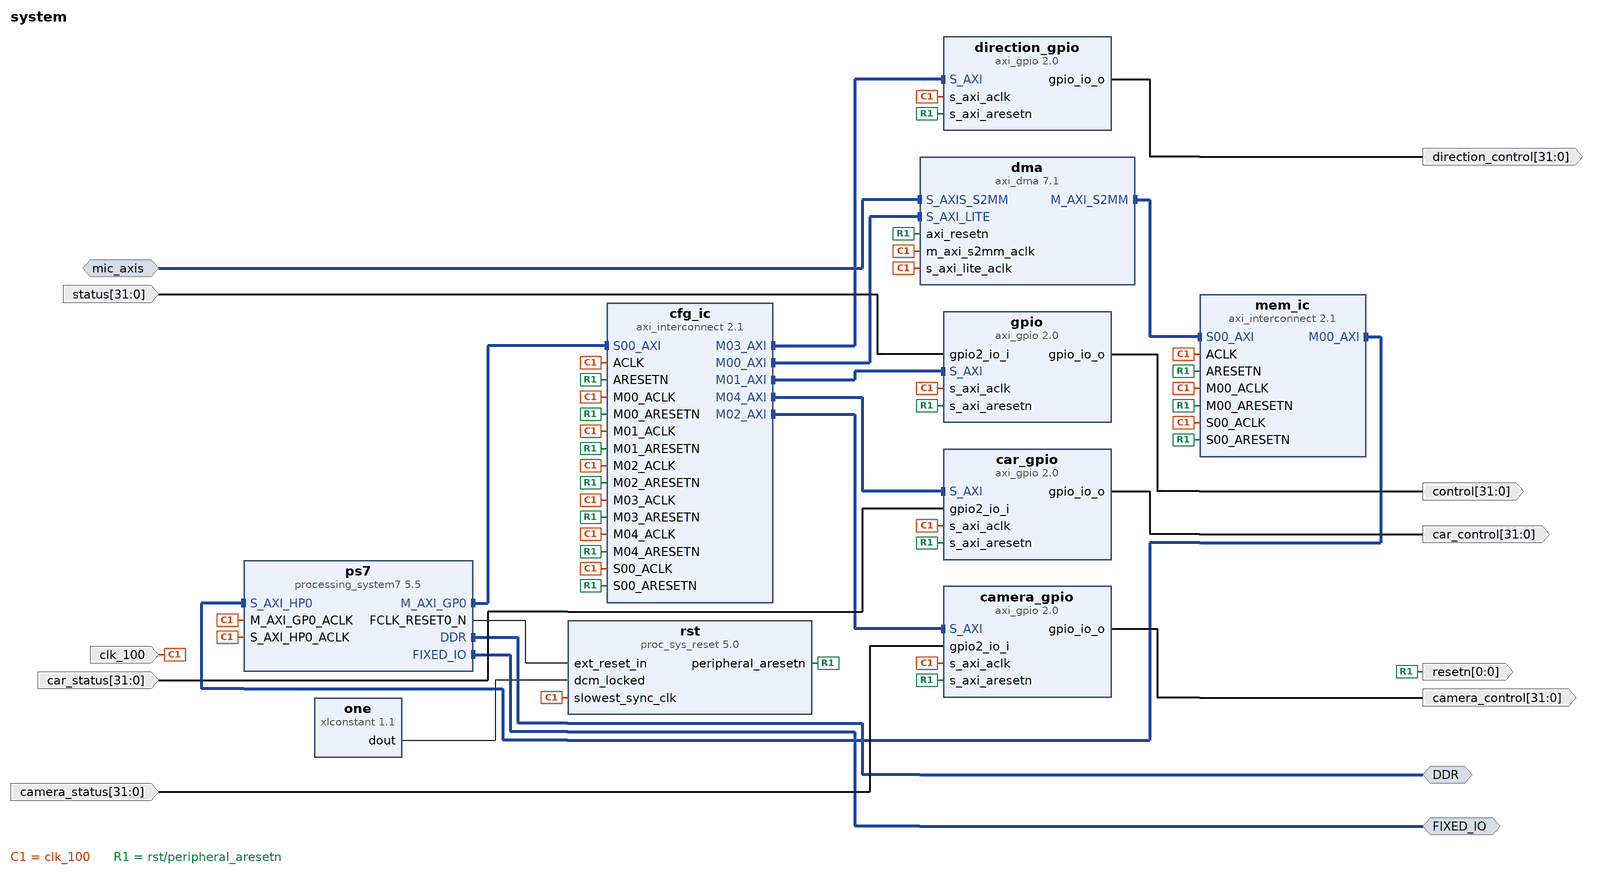
[diagram p0: block diagram of the top level]
# Vivado block design system, xc7z100ffg900-2, Vivado 2025.2
create_bd_design system

create_bd_intf_port -mode Master -vlnv xilinx.com:interface:ddrx_rtl:1.0 DDR
create_bd_intf_port -mode Master -vlnv xilinx.com:display_processing_system7:fixedio_rtl:1.0 FIXED_IO
create_bd_intf_port -mode Slave -vlnv xilinx.com:interface:axis_rtl:1.0 mic_axis
set_property -dict [list \
  CONFIG.FREQ_HZ 100000000 \
  CONFIG.HAS_TKEEP 1 \
  CONFIG.HAS_TLAST 1 \
  CONFIG.HAS_TREADY 1 \
  CONFIG.HAS_TSTRB 0 \
  CONFIG.LAYERED_METADATA undef \
  CONFIG.TDATA_NUM_BYTES 4 \
  CONFIG.TDEST_WIDTH 0 \
  CONFIG.TID_WIDTH 0 \
  CONFIG.TUSER_WIDTH 0 \
] [get_bd_intf_ports mic_axis]
create_bd_port -dir I -type clk clk_100
set_property -dict {CONFIG.ASSOCIATED_BUSIF mic_axis CONFIG.FREQ_HZ 100000000} [get_bd_ports clk_100]
create_bd_port -dir O -from 0 -to 0 -type rst resetn
set_property -dict {CONFIG.POLARITY ACTIVE_LOW} [get_bd_ports resetn]
create_bd_port -dir O -from 31 -to 0 control
create_bd_port -dir I -from 31 -to 0 status
create_bd_port -dir O -from 31 -to 0 camera_control
create_bd_port -dir I -from 31 -to 0 camera_status
create_bd_port -dir O -from 31 -to 0 direction_control
create_bd_port -dir O -from 31 -to 0 car_control
create_bd_port -dir I -from 31 -to 0 car_status

create_bd_cell -type ip -vlnv xilinx.com:ip:processing_system7:5.5 ps7
set_property -dict [list \
  CONFIG.PCW_APU_PERIPHERAL_FREQMHZ 666.666666 \
  CONFIG.PCW_CPU_CPU_6X4X_MAX_RANGE 800 \
  CONFIG.PCW_ENET0_PERIPHERAL_ENABLE 0 \
  CONFIG.PCW_FPGA0_PERIPHERAL_FREQMHZ 100 \
  CONFIG.PCW_FPGA1_PERIPHERAL_FREQMHZ 25 \
  CONFIG.PCW_GPIO_MIO_GPIO_ENABLE 0 \
  CONFIG.PCW_PERIPHERAL_BOARD_PRESET None \
  CONFIG.PCW_PRESET_BANK1_VOLTAGE {LVCMOS 1.8V} \
  CONFIG.PCW_QSPI_PERIPHERAL_ENABLE 0 \
  CONFIG.PCW_SD0_PERIPHERAL_ENABLE 0 \
  CONFIG.PCW_UART0_PERIPHERAL_ENABLE 1 \
  CONFIG.PCW_UART0_UART0_IO {MIO 14 .. 15} \
  CONFIG.PCW_UART1_PERIPHERAL_ENABLE 0 \
  CONFIG.PCW_UART_PERIPHERAL_FREQMHZ 100 \
  CONFIG.PCW_UIPARAM_DDR_FREQ_MHZ 533.3333333333333 \
  CONFIG.PCW_UIPARAM_DDR_MEMORY_TYPE {DDR 3 (Low Voltage)} \
  CONFIG.PCW_UIPARAM_DDR_PARTNO {MT41K256M16 RE-125} \
  CONFIG.PCW_USB0_PERIPHERAL_ENABLE 0 \
  CONFIG.PCW_USB1_PERIPHERAL_ENABLE 1 \
  CONFIG.PCW_USB1_USB1_IO {MIO 40 .. 51} \
  CONFIG.PCW_USE_S_AXI_HP0 1 \
] [get_bd_cells ps7]
# 368 more settings of ps7 are not shown: defaults, MIO pin electricals, DDR timing, and values the tool derives
create_bd_cell -type ip -vlnv xilinx.com:ip:proc_sys_reset:5.0 rst
create_bd_cell -type ip -vlnv xilinx.com:ip:xlconstant:1.1 one
set_property -dict {CONFIG.CONST_VAL 1} [get_bd_cells one]
create_bd_cell -type ip -vlnv xilinx.com:ip:axi_dma:7.1 dma
set_property -dict [list \
  CONFIG.c_include_mm2s 0 \
  CONFIG.c_include_s2mm_dre 0 \
  CONFIG.c_include_sg 0 \
  CONFIG.c_s_axis_s2mm_tdata_width 32 \
  CONFIG.c_sg_length_width 23 \
] [get_bd_cells dma]
create_bd_cell -type ip -vlnv xilinx.com:ip:axi_gpio:2.0 gpio
set_property -dict [list \
  CONFIG.C_ALL_INPUTS_2 1 \
  CONFIG.C_ALL_OUTPUTS 1 \
  CONFIG.C_GPIO2_WIDTH 32 \
  CONFIG.C_GPIO_WIDTH 32 \
  CONFIG.C_IS_DUAL 1 \
] [get_bd_cells gpio]
create_bd_cell -type ip -vlnv xilinx.com:ip:axi_interconnect:2.1 cfg_ic
set_property -dict {CONFIG.NUM_MI 5} [get_bd_cells cfg_ic]
create_bd_cell -type ip -vlnv xilinx.com:ip:axi_interconnect:2.1 mem_ic
set_property -dict {CONFIG.NUM_MI 1} [get_bd_cells mem_ic]
create_bd_cell -type ip -vlnv xilinx.com:ip:axi_gpio:2.0 camera_gpio
set_property -dict [list \
  CONFIG.C_ALL_INPUTS_2 1 \
  CONFIG.C_ALL_OUTPUTS 1 \
  CONFIG.C_GPIO2_WIDTH 32 \
  CONFIG.C_GPIO_WIDTH 32 \
  CONFIG.C_IS_DUAL 1 \
] [get_bd_cells camera_gpio]
create_bd_cell -type ip -vlnv xilinx.com:ip:axi_gpio:2.0 direction_gpio
set_property -dict {CONFIG.C_ALL_OUTPUTS 1 CONFIG.C_GPIO_WIDTH 32 CONFIG.C_IS_DUAL 0} [get_bd_cells direction_gpio]
create_bd_cell -type ip -vlnv xilinx.com:ip:axi_gpio:2.0 car_gpio
set_property -dict [list \
  CONFIG.C_ALL_INPUTS_2 1 \
  CONFIG.C_ALL_OUTPUTS 1 \
  CONFIG.C_GPIO2_WIDTH 32 \
  CONFIG.C_GPIO_WIDTH 32 \
  CONFIG.C_IS_DUAL 1 \
] [get_bd_cells car_gpio]

# ---- connections ----

connect_bd_intf_net [get_bd_intf_pins cfg_ic/M00_AXI] [get_bd_intf_pins dma/S_AXI_LITE]
connect_bd_intf_net [get_bd_intf_pins cfg_ic/M01_AXI] [get_bd_intf_pins gpio/S_AXI]
connect_bd_intf_net [get_bd_intf_pins cfg_ic/M02_AXI] [get_bd_intf_pins camera_gpio/S_AXI]
connect_bd_intf_net [get_bd_intf_pins cfg_ic/M03_AXI] [get_bd_intf_pins direction_gpio/S_AXI]
connect_bd_intf_net [get_bd_intf_pins cfg_ic/M04_AXI] [get_bd_intf_pins car_gpio/S_AXI]
connect_bd_intf_net [get_bd_intf_pins dma/M_AXI_S2MM] [get_bd_intf_pins mem_ic/S00_AXI]
connect_bd_intf_net [get_bd_intf_pins mem_ic/M00_AXI] [get_bd_intf_pins ps7/S_AXI_HP0]
connect_bd_intf_net [get_bd_intf_ports mic_axis] [get_bd_intf_pins dma/S_AXIS_S2MM]
connect_bd_intf_net [get_bd_intf_ports DDR] [get_bd_intf_pins ps7/DDR]
connect_bd_intf_net [get_bd_intf_ports FIXED_IO] [get_bd_intf_pins ps7/FIXED_IO]
connect_bd_intf_net [get_bd_intf_pins ps7/M_AXI_GP0] [get_bd_intf_pins cfg_ic/S00_AXI]
connect_bd_net [get_bd_pins camera_gpio/gpio_io_o] [get_bd_ports camera_control]
connect_bd_net [get_bd_ports camera_status] [get_bd_pins camera_gpio/gpio2_io_i]
connect_bd_net [get_bd_pins car_gpio/gpio_io_o] [get_bd_ports car_control]
connect_bd_net [get_bd_ports car_status] [get_bd_pins car_gpio/gpio2_io_i]
connect_bd_net -net clk_100_1 [get_bd_ports clk_100] \
  [get_bd_pins ps7/M_AXI_GP0_ACLK] [get_bd_pins ps7/S_AXI_HP0_ACLK] [get_bd_pins rst/slowest_sync_clk] \
  [get_bd_pins dma/s_axi_lite_aclk] [get_bd_pins dma/m_axi_s2mm_aclk] [get_bd_pins gpio/s_axi_aclk] [get_bd_pins cfg_ic/ACLK] \
  [get_bd_pins cfg_ic/S00_ACLK] [get_bd_pins cfg_ic/M00_ACLK] [get_bd_pins cfg_ic/M01_ACLK] [get_bd_pins mem_ic/ACLK] \
  [get_bd_pins mem_ic/S00_ACLK] [get_bd_pins mem_ic/M00_ACLK] [get_bd_pins camera_gpio/s_axi_aclk] \
  [get_bd_pins cfg_ic/M02_ACLK] [get_bd_pins direction_gpio/s_axi_aclk] [get_bd_pins cfg_ic/M03_ACLK] \
  [get_bd_pins car_gpio/s_axi_aclk] [get_bd_pins cfg_ic/M04_ACLK]
connect_bd_net [get_bd_pins direction_gpio/gpio_io_o] [get_bd_ports direction_control]
connect_bd_net [get_bd_pins gpio/gpio_io_o] [get_bd_ports control]
connect_bd_net [get_bd_pins one/dout] [get_bd_pins rst/dcm_locked]
connect_bd_net [get_bd_pins ps7/FCLK_RESET0_N] [get_bd_pins rst/ext_reset_in]
connect_bd_net [get_bd_pins rst/peripheral_aresetn] \
  [get_bd_ports resetn] [get_bd_pins dma/axi_resetn] [get_bd_pins gpio/s_axi_aresetn] [get_bd_pins cfg_ic/ARESETN] \
  [get_bd_pins cfg_ic/S00_ARESETN] [get_bd_pins cfg_ic/M00_ARESETN] [get_bd_pins cfg_ic/M01_ARESETN] \
  [get_bd_pins mem_ic/ARESETN] [get_bd_pins mem_ic/S00_ARESETN] [get_bd_pins mem_ic/M00_ARESETN] \
  [get_bd_pins camera_gpio/s_axi_aresetn] [get_bd_pins cfg_ic/M02_ARESETN] [get_bd_pins direction_gpio/s_axi_aresetn] \
  [get_bd_pins cfg_ic/M03_ARESETN] [get_bd_pins car_gpio/s_axi_aresetn] [get_bd_pins cfg_ic/M04_ARESETN]
connect_bd_net [get_bd_ports status] [get_bd_pins gpio/gpio2_io_i]

# ---- address map ----
assign_bd_address -offset 0x00000000 -range 1G -target_address_space [get_bd_addr_spaces dma/Data_S2MM] [get_bd_addr_segs ps7/S_AXI_HP0/HP0_DDR_LOWOCM]
assign_bd_address -offset 0x40400000 -range 64K -target_address_space [get_bd_addr_spaces ps7/Data] [get_bd_addr_segs dma/S_AXI_LITE/Reg]
assign_bd_address -offset 0x41200000 -range 64K -target_address_space [get_bd_addr_spaces ps7/Data] [get_bd_addr_segs gpio/S_AXI/Reg]
assign_bd_address -offset 0x41210000 -range 64K -target_address_space [get_bd_addr_spaces ps7/Data] [get_bd_addr_segs camera_gpio/S_AXI/Reg]
assign_bd_address -offset 0x41220000 -range 64K -target_address_space [get_bd_addr_spaces ps7/Data] [get_bd_addr_segs direction_gpio/S_AXI/Reg]
assign_bd_address -offset 0x41230000 -range 64K -target_address_space [get_bd_addr_spaces ps7/Data] [get_bd_addr_segs car_gpio/S_AXI/Reg]

validate_bd_design
save_bd_design
